# EAGLE design Interpreter Circuit (final) (EAGLE 9.6.2)
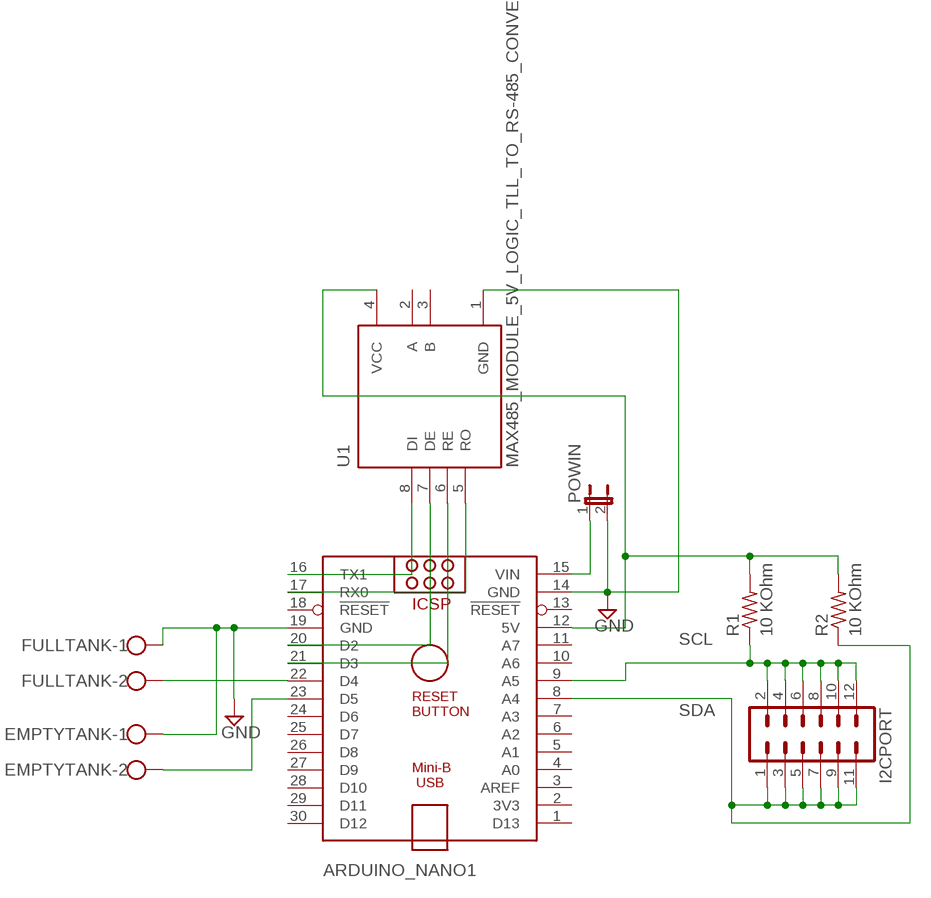
[diagram p0: schematic, sheet 1]

## Parts
ARDUINO_NANO1  ARDUINO_NANO  [ARDUINO_NANO]
EMPTYTANK  W237-102  [W237-102]
FULLTANK  W237-102  [W237-102]
I2CPORT  MA06-2  [MA06-2]
POWIN  JP1E  [JP1]
R1  10 KOhm  R-US_0204/7  [0204/7]
R2  10 KOhm  R-US_0204/7  [0204/7]
U1  MAX485_MODULE_5V_LOGIC_TLL_TO_RS-485_CONVERTER  [MODULE_MAX485_MODULE_5V_LOGIC_TLL_TO_RS-485_CONVERTER]

## Nets
GND: ARDUINO_NANO1.14(GND) ARDUINO_NANO1.19(GND) EMPTYTANK.1 FULLTANK.1 POWIN.2 U1.1(GND)
N$1: ARDUINO_NANO1.17(RX0) U1.5(RO)
N$2: ARDUINO_NANO1.16(TX1) U1.8(DI)
N$3: ARDUINO_NANO1.20(D2) U1.7(DE)
N$4: ARDUINO_NANO1.21(D3) U1.6(RE)
N$5: ARDUINO_NANO1.22(D4) FULLTANK.2
N$6: ARDUINO_NANO1.12(5V) R1.2 R2.2 U1.4(VCC)
N$7: ARDUINO_NANO1.23(D5) EMPTYTANK.2
N$10: ARDUINO_NANO1.15(VIN) POWIN.1
SCL: ARDUINO_NANO1.9(A5) I2CPORT.2 I2CPORT.4 I2CPORT.6 I2CPORT.8 I2CPORT.10 I2CPORT.12 R1.1
SDA: ARDUINO_NANO1.8(A4) I2CPORT.1 I2CPORT.3 I2CPORT.5 I2CPORT.7 I2CPORT.9 I2CPORT.11 R2.1
Unconnected: ARDUINO_NANO1.1(D13) ARDUINO_NANO1.2(3V3) ARDUINO_NANO1.3(AREF) ARDUINO_NANO1.4(A0) ARDUINO_NANO1.5(A1) ARDUINO_NANO1.6(A2) ARDUINO_NANO1.7(A3) ARDUINO_NANO1.10(A6) ARDUINO_NANO1.11(A7) ARDUINO_NANO1.13(!RESET) ARDUINO_NANO1.18(!RESET) ARDUINO_NANO1.24(D6) ARDUINO_NANO1.25(D7) ARDUINO_NANO1.26(D8) ARDUINO_NANO1.27(D9) ARDUINO_NANO1.28(D10) ARDUINO_NANO1.29(D11) ARDUINO_NANO1.30(D12) U1.2(A) U1.3(B)

## Library data of the parts
ARDUINO_NANO1 = ArduinoNanoV30:ARDUINO_NANO: Arduino Nano V3.0 Overview: The Arduino Nano is a small, complete, and breadboard-friendly board based on the ATmega328 (Arduino Nano 3.x) or ATmega168 (Arduino Nano 2.x). It has more or less the same functionality of the Arduino Duemilanove, but in a different package. It lacks only a DC power jack, and works with a Mini-B USB cable instead of a standard one. The Nano was designed and is being produced by Gravitech. Specifications: Microcontroller Atmel ATmega168 or ATmega328 Operating Voltage (logic level) 5 V Input Voltage (recommended) 7-12 V Input Voltage (limits) 6-20 V Digital I/O Pins 14 (of which 6 provide PWM output) Analog Input Pins 8 DC Current per I/O Pin 40 mA Flash Memory 16 KB (ATmega168) or 32 KB (ATmega328) of which 2 KB used by bootloader SRAM 1 KB (ATmega168) or 2 KB (ATmega328) EEPROM 512 bytes (ATmega168) or 1 KB (ATmega328) Clock Speed 16 MHz Dimensions 0.73" x 1.70" Length 45 mm Width 18 mm Weigth 5 g Power: The Arduino Nano can be powered via the Mini-B USB connection, 6-20V unregulated external power supply (pin 30), or 5V regulated external power supply (pin 27). The power source is automatically selected to the highest voltage source. Memory: The ATmega168 has 16 KB of flash memory for storing code (of which 2 KB is used for the bootloader); the ATmega328 has 32 KB, (also with 2 KB used for the bootloader). The ATmega168 has 1 KB of SRAM and 512 bytes of EEPROM (which can be read and written with the EEPROM library); the ATmega328 has 2 KB of SRAM and 1 KB of EEPROM. Input and Output: Each of the 14 digital pins on the Nano can be used as an input or output, using pinMode(), digitalWrite(), and digitalRead() functions. They operate at 5 volts. Each pin can provide or receive a maximum of 40 mA and has an internal pull-up resistor (disconnected by default) of 20-50 kOhms. In addition, some pins have specialized functions. Visit Arduino - ArduinoBoardNano <https://www.arduino.cc/en/Main/ArduinoBoardNano>
EMPTYTANK FULLTANK = con-wago-500:W237-102: WAGO SCREW CLAMP; MPN: 237-102; OC_FARNELL: unknown; OC_NEWARK: 70K9898
I2CPORT = con-lstb:MA06-2: PIN HEADER; OC_FARNELL: unknown; OC_NEWARK: unknown
POWIN = jumper:JP1E: JUMPER
R1 R2 = rcl:R-US_: RESISTOR, American symbol; SPICEPREFIX: R
U1 = MAX485_MODULE_5V_LOGIC_TLL_TO_RS-485_CONVERTER:MAX485_MODULE_5V_LOGIC_TLL_TO_RS-485_CONVERTER: Check availability <https://pricing.snapeda.com/parts/MAX485%20Module%205V%20logic%20TLL%20to%20RS-485%20converter/e-Gizmo%20Mechatronix%20Central/view-part?ref=eda>; AVAILABILITY: Not in stock; DESCRIPTION: 5V MAX485 TTL To RS485 Converter Module Board for Arduino; MF: e-Gizmo Mechatronix Central; MP: MAX485 Module 5V logic TLL to RS-485 converter; PACKAGE: Package; PRICE: None

## Board
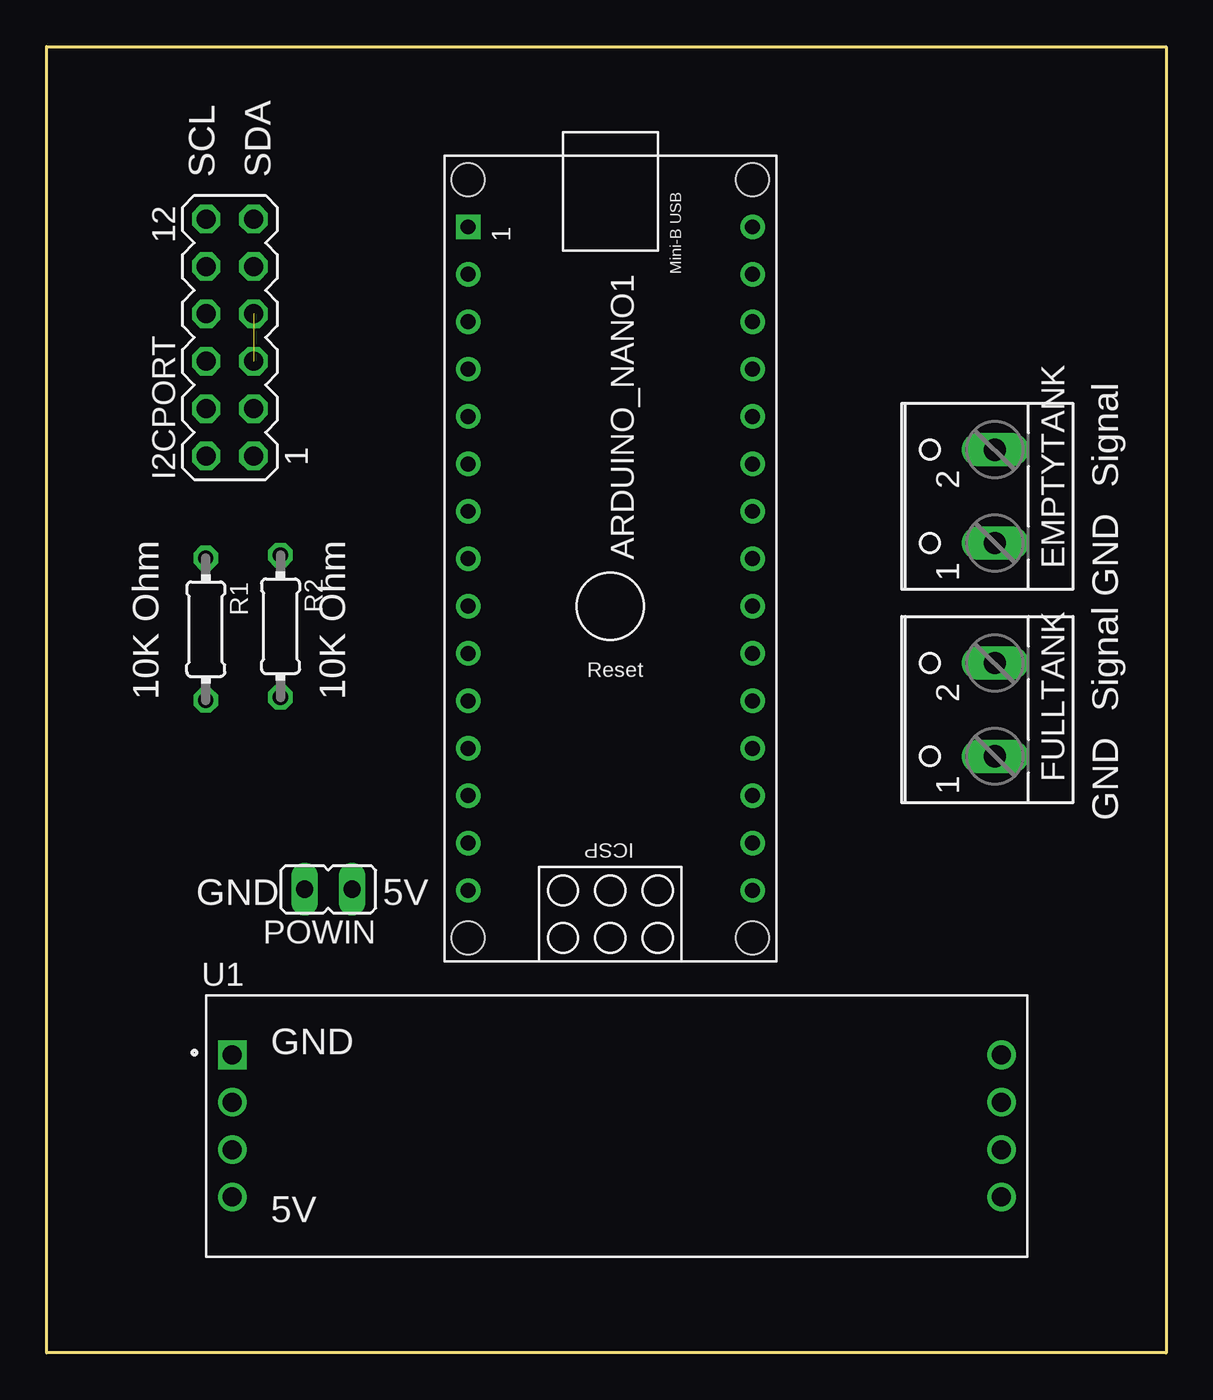
[diagram p1: board, top side]
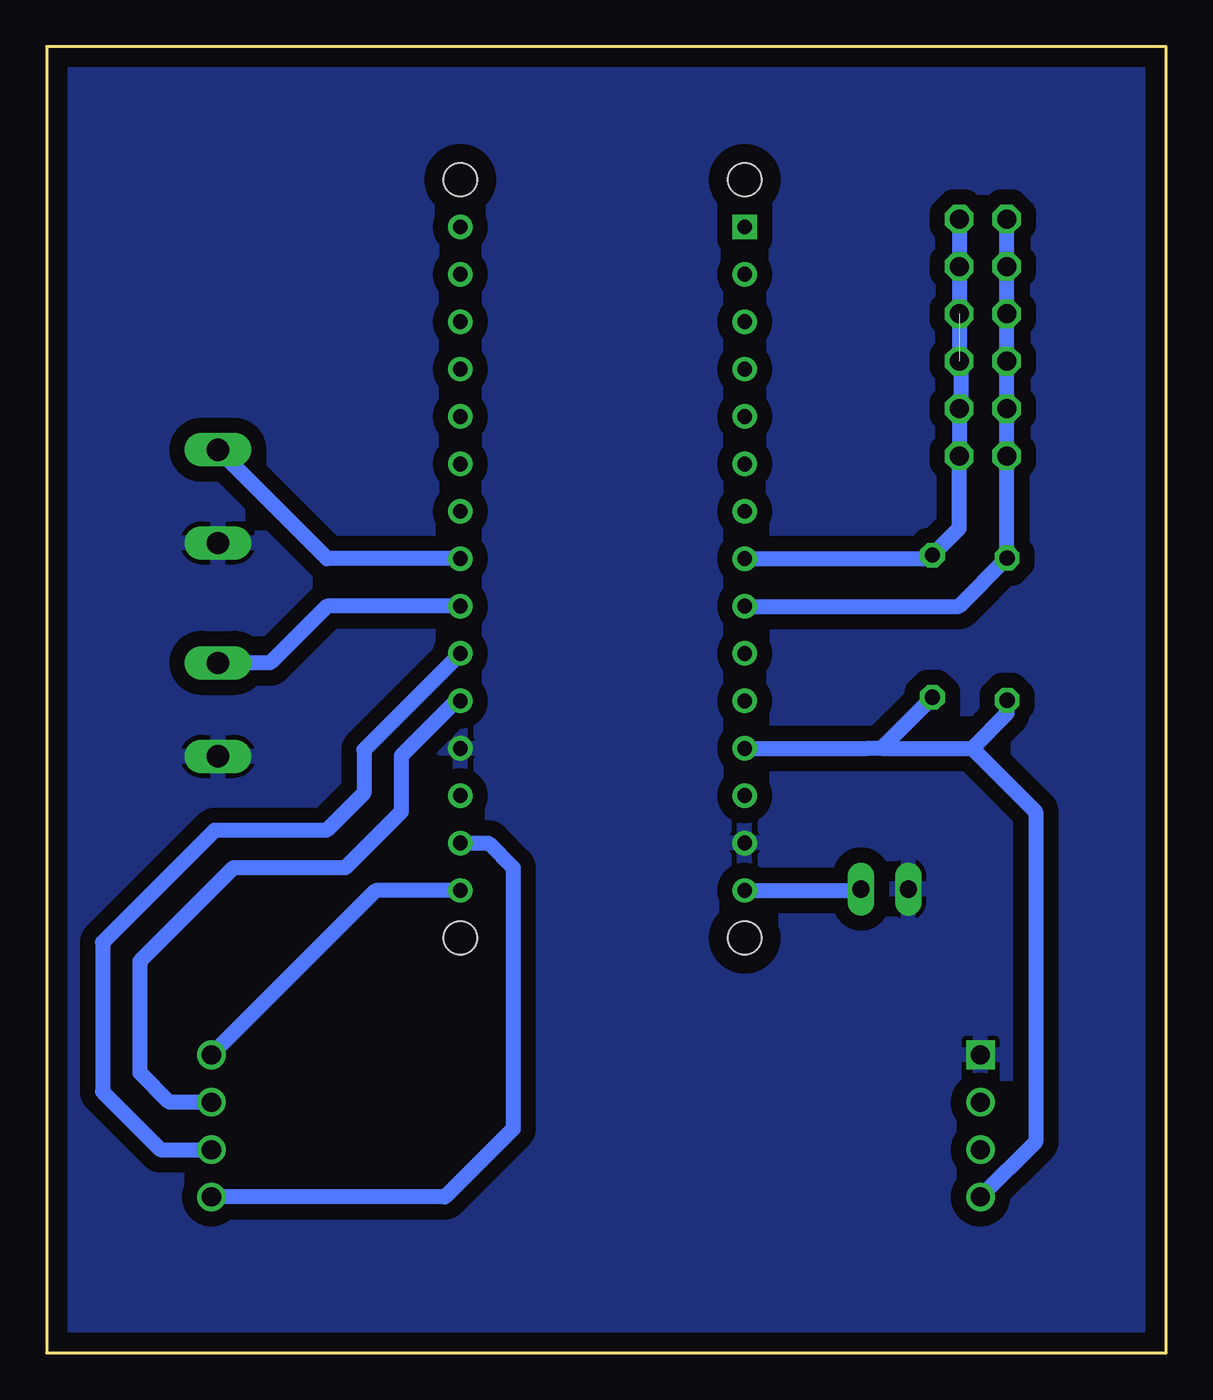
[diagram p2: board, bottom side, seen from below]

Size 60 x 70 mm. Coordinates in mm from the lower left corner, seen from the top.
Outline: 0,0 0,70 60,70 60,0 0,0
Copper layers (1*16): Top 0.035mm / dielectric 1.5mm / Bottom 0.035mm
Design rules "default": minimum track width 6mil, minimum drill 0.35mm, track to track 6mil, track to pad 6mil, pad to pad 6mil, via to via 6mil, smd to smd 6mil, copper to edge 40mil, drill to drill 6mil, minimum pad ring 10mil, minimum via ring 8mil, stop-mask expansion 4mil, vias tented up to drill 0mil, thermal gap 10mil

### Footprints (pad centres in the part's own frame; a part is rotated, then mirrored left to right if it is on the bottom)
ARDUINO_NANO = drill 0.8 square: 1 -20.32,-7.62 | drill 0.8: 2 -17.78,-7.62; 3 -15.24,-7.62; 4 -12.7,-7.62; 5 -10.16,-7.62; 6 -7.62,-7.62; 7 -5.08,-7.62; 8 -2.54,-7.62; 9 0,-7.62; 10 2.54,-7.62; 11 5.08,-7.62; 12 7.62,-7.62; 13 10.16,-7.62; 14 12.7,-7.62; 15 15.24,-7.62; 16 15.24,7.62; 17 12.7,7.62; 18 10.16,7.62; 19 7.62,7.62; 20 5.08,7.62; 21 2.54,7.62; 22 0,7.62; 23 -2.54,7.62; 24 -5.08,7.62; 25 -7.62,7.62; 26 -10.16,7.62; 27 -12.7,7.62; 28 -15.24,7.62; 29 -17.78,7.62; 30 -20.32,7.62 | hole 1.778: -22.86,-7.62; -22.86,7.62; 17.78,7.62; 17.78,-7.62
W237-102 = drill 1.194 long: 1 -2.5,-1.27; 2 2.5,-1.27
MA06-2 = drill 1.016 octagon: 1 -6.35,-1.27; 2 -6.35,1.27; 3 -3.81,-1.27; 4 -3.81,1.27; 5 -1.27,-1.27; 6 -1.27,1.27; 7 1.27,-1.27; 8 1.27,1.27; 9 3.81,-1.27; 10 3.81,1.27; 11 6.35,-1.27; 12 6.35,1.27
JP1 = drill 0.914 long: 1 0,-1.27; 2 0,1.27
0204/7 = drill 0.813 octagon: 1 -3.81,0; 2 3.81,0
MODULE_MAX485_MODULE_5V_LOGIC_TLL_TO_RS-485_CONVERTER = drill 1.02 square: 1 -20.6,3.81 | drill 1.02: 2 -20.6,1.27; 3 -20.6,-1.27; 4 -20.6,-3.81; 5 20.62,-3.81; 6 20.62,-1.27; 7 20.62,1.27; 8 20.62,3.81

### Placement (x,y rotation side)
ARDUINO_NANO1  30.21,40.02 270 top
EMPTYTANK  49.55,45.9 90 top
FULLTANK  49.55,34.47 90 top
I2CPORT  9.82,54.41 90 top
POWIN  15.09,24.85 90 top
R1  8.53,38.78 270 top
R2  12.53,38.94 270 top
U1  30.55,12.16 0 top

### Tracks (layer width: path | path; a pad name or v marks a point on that pad's centre or on a via)
GND
  pour Bottom (isolate 0.813): 0,0 0,70 60,70 60,0
N$1
  Bottom 0.813: ARDUINO_NANO1.17 36.32,27.32 35,26 35,12 38.65,8.35 U1.5
N$2
  Bottom 0.813: ARDUINO_NANO1.16 42.36,24.78 U1.8
N$3
  Bottom 0.813: U1.7 53.43,13.43 55,15 55,21 50,26 44,26 41,29 41,32 38.06,34.94 ARDUINO_NANO1.20
N$4
  Bottom 0.813: ARDUINO_NANO1.21 43,32.31 43,30 45,28 51,28 57,22 57,14 53.89,10.89 U1.6
N$5
  Bottom 0.813: ARDUINO_NANO1.22 44.98,40.02 48.03,36.97 FULLTANK.2
N$6
  Bottom 0.813: ARDUINO_NANO1.12 16,32.4 15.26,32.4 | 15.26,32.4 10.4,32.4 | 10.4,32.4 7,29 7,11.3 U1.4 | R1.2 8.53,34.27 10.4,32.4 | R2.2 15.26,32.4
N$7
  Bottom 0.813: ARDUINO_NANO1.23 44.98,42.56 EMPTYTANK.2
N$10
  Bottom 0.813: ARDUINO_NANO1.15 16.43,24.78 POWIN.1
SCL
  Bottom 0.813: I2CPORT.12 I2CPORT.10 I2CPORT.8 I2CPORT.6 I2CPORT.4 I2CPORT.2 8.53,48.04 R1.1 11.12,40 22.57,40 ARDUINO_NANO1.9
SDA  (1 unrouted)
  Bottom 0.813: I2CPORT.11 I2CPORT.9 I2CPORT.7 11.09,53.09 11,53 11,50.69 I2CPORT.3 I2CPORT.1 11.09,44.19 R2.1 12.72,42.56 ARDUINO_NANO1.8

### Text on the board
tNames: SCL | SDA | Signal | GND | Signal | 10K Ohm | 10K Ohm | GND | GND | 5V | GND | 5V